# Altium schematic sheet Sheet01.SchDoc
size A4; SheetNumber: 1; SheetTotal: 1
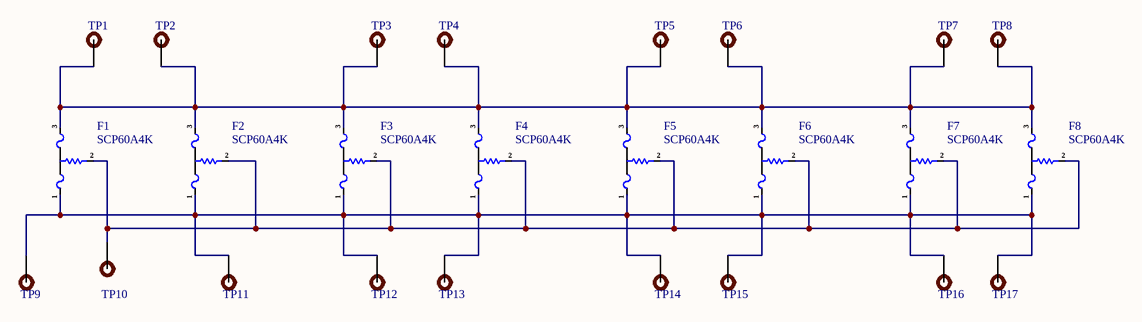
[diagram p0: Sheet01.SchDoc]

## Parts
F1  SCP60A4K  [SCP60a4k]
F2  SCP60A4K  [SCP60a4k]
F3  SCP60A4K  [SCP60a4k]
F4  SCP60A4K  [SCP60a4k]
F5  SCP60A4K  [SCP60a4k]
F6  SCP60A4K  [SCP60a4k]
F7  SCP60A4K  [SCP60a4k]
F8  SCP60A4K  [SCP60a4k]
TP1  3x4mm Test Pad SMD  [3x4mm Test Pad SMD]  (value not drawn)
TP2  3x4mm Test Pad SMD  [3x4mm Test Pad SMD]  (value not drawn)
TP3  3x4mm Test Pad SMD  [3x4mm Test Pad SMD]  (value not drawn)
TP4  3x4mm Test Pad SMD  [3x4mm Test Pad SMD]  (value not drawn)
TP5  3x4mm Test Pad SMD  [3x4mm Test Pad SMD]  (value not drawn)
TP6  3x4mm Test Pad SMD  [3x4mm Test Pad SMD]  (value not drawn)
TP7  3x4mm Test Pad SMD  [3x4mm Test Pad SMD]  (value not drawn)
TP8  3x4mm Test Pad SMD  [3x4mm Test Pad SMD]  (value not drawn)
TP9  3x4mm Test Pad SMD  [3x4mm Test Pad SMD]  (value not drawn)
TP10  10X10MM TEST PAD SMD  [10X10MM TEST PAD SMD]  (value not drawn)
TP11  3x4mm Test Pad SMD  [3x4mm Test Pad SMD]  (value not drawn)
TP12  3x4mm Test Pad SMD  [3x4mm Test Pad SMD]  (value not drawn)
TP13  3x4mm Test Pad SMD  [3x4mm Test Pad SMD]  (value not drawn)
TP14  3x4mm Test Pad SMD  [3x4mm Test Pad SMD]  (value not drawn)
TP15  3x4mm Test Pad SMD  [3x4mm Test Pad SMD]  (value not drawn)
TP16  3x4mm Test Pad SMD  [3x4mm Test Pad SMD]  (value not drawn)
TP17  3x4mm Test Pad SMD  [3x4mm Test Pad SMD]  (value not drawn)

## Nets
NetF1_1: F1.1 F2.1 F3.1 F4.1 F5.1 F6.1 F7.1 F8.1 TP9.1 TP11.1 TP12.1 TP13.1 TP14.1 TP15.1 TP16.1 TP17.1
NetF1_2: F1.2 F2.2 F3.2 F4.2 F5.2 F6.2 F7.2 F8.2 TP10.1
NetF1_3: F1.3 F2.3 F3.3 F4.3 F5.3 F6.3 F7.3 F8.3 TP1.1 TP2.1 TP3.1 TP4.1 TP5.1 TP6.1 TP7.1 TP8.1

## Notes on the sheet
- File:
- Title:
- Date:
- Page
- Num:
- Total:
- Drawn By: Huzaifa Ali

## Library data of the parts
F1-F8 = SCP60A4K: Self Control Protector; Manufacturer Part Number: SCP60A4K